# Altium schematic sheet Power supply.SchDoc
size A; SheetNumber: 3; SheetTotal: 5
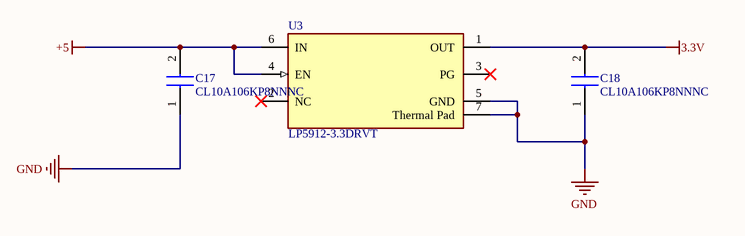
[diagram p0: Power supply.SchDoc]

## Parts
C17  CL10A106KP8NNNC  [CAPC1608X90N]
C18  CL10A106KP8NNNC  [CAPC1608X90N]
U3  LP5912-3.3DRVT  [FP-DRV0006A-IPC_C]

## Nets
3.3V: C18.2 U3.1(OUT)
+5: C17.2 U3.4(EN) U3.6(IN)
GND: C17.1 C18.1 U3.5(GND) U3.7(Thermal_Pad)

Not connected (* = marked no-connect by the designer): U3 2(NC)* 3(PG)*

## Library data of the parts
C17 C18 = CL10A106KP8NNNC: Capacitor; Manufacturer_Name: SAMSUNG; Datasheet Link: https://datasheet.datasheetarchive.com/originals/distributors/Datasheets-DGA10/2415998.pdf; Height: 0.9mm; Manufacturer_Part_Number: CL10A106KP8NNNC; Mouser Part Number: 187-CL10A106KP8NNNC; Mouser Price/Stock: https://www.mouser.co.uk/ProductDetail/Samsung-Electro-Mechanics/CL10A106KP8NNNC?qs=X6jEic%2FHinAlyfRHj7fKwg%3D%3D; Arrow Part Number: CL10A106KP8NNNC; Arrow Price/Stock: https://www.arrow.com/en/products/cl10a106kp8nnnc/samsung-electro-mechanics.html?utm_currency=USD&region=europe
U3 = CMP-019-00055-1: 500mA 40dB@(100kHz) Fixed 3.3V Positive 6.5V DFN-6(2x2) Linear Voltage Regulators (LDO) ROHS; Manufacturer Lifecycle Status: ACTIVE; Dropout Voltage: 950mV; Number of Regulators: 1; Quiescent Current: 30µA; Height: 800µm; Packaging: Cut Tape; Mounting Technology: Surface Mount; Output Voltage: 3.3V; Output Type: Fixed; Length: 2mm; Lead Free: Lead Free; Thickness: 750µm; Output Current: 500mA; Lifecycle Status: Production; Max Operating Temperature: 125°C; RoHS: Compliant; Min Operating Temperature: -40°C; Number of Channels: 1; Pins: 6; Width: 2mm; Schedule B: 8542390000, 8542390000